# Altium schematic sheet Digital_Supply.SchDoc
size A; SheetNumber: 3; SheetTotal: 6
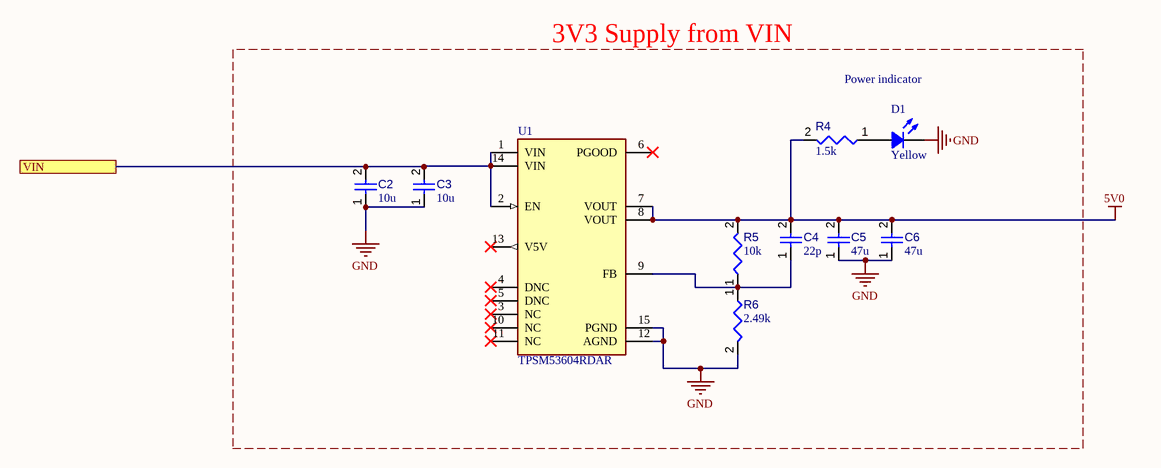
[diagram p0: Digital_Supply.SchDoc]

## Parts
C2  value 10u  [CAPC3216X180X50NL20T25]  (hidden comment: Capacitor 10 uF +/- 10% 16 V 1206)
C3  value 10u  [CAPC3216X180X50NL20T25]  (hidden comment: Capacitor 10 uF +/- 10% 16 V 1206)
C4  value 22p  [CAPC0402(1005)60_L]  (hidden comment: Capacitor 22pF +/-10% 50V 0402)
C5  value 47u  [CAPC3216X180X50NL20T25]  (hidden comment: Capacitor 10 uF +/- 10% 16 V 1206)
C6  value 47u  [CAPC3216X180X50NL20T25]  (hidden comment: Capacitor 10 uF +/- 10% 16 V 1206)
D1  Yellow  [LED 0402_1005 YELLOW]
R4  value 1.5k  [RESC1005X40X25ML05T05]  (hidden comment: Resistor 10k +/-1% 0402 63 mW)
R5  value 10k  [RESC1005X40X25ML05T05]  (hidden comment: Resistor 10k +/-1% 0402 63 mW)
R6  value 2.49k  [RESC1005X40X25ML05T05]  (hidden comment: Resistor 10k +/-1% 0402 63 mW)
U1  TPSM53604RDAR  [FP-RDA0015A-MFG]

## Ports
VIN

## Nets
5V0: C4.2 C5.2 C6.2 R4.2 R5.2 U1.7(VOUT) U1.8(VOUT)
GND: C2.1 C3.1 C5.1 C6.1 D1.2 R6.2 U1.12(AGND) U1.15(PGND)
VIN: C2.2 C3.2 U1.1(VIN) U1.2(EN) U1.14(VIN) ; port VIN
NetC4_1: C4.1 R5.1 R6.1 U1.9(FB)
NetD1_1: D1.1 R4.1

Not connected (* = marked no-connect by the designer): U1 3(NC)* 4(DNC)* 5(DNC)* 6(PGOOD)* 10(NC)* 11(NC)* 13(V5V)*

## Notes on the sheet
- 3V3 Supply from VIN
- Power indicator

## Library data of the parts
C2 C3 C5 C6 = CMP-001-00016-6: Chip Capacitor, 47 uF, +/- 10%, 16 V, 1206 (3216 Metric); Capacitor Type: Ceramic; Voltage Rating: 16V; Tolerance: 10%; Min Operating Temperature: -55°C; Pins: 2; Mounting Technology: SM; Case/Package: 1206; Max Operating Temperature: 125°C; RoHS Compliant: True
C4 = CMP-001-00073-3: Chip Capacitor, 22pF +/-10%, 50V, 0402, Thickness 0.6 mm; Tolerance: 10%; Pins: 2; Voltage Rating: 50V; Max Operating Temperature: 85°C; Min Operating Temperature: -55°C; Mounting Technology: SMT; Case/Package: 0402
D1 = BL-HKC37A-AV-TRB: 0402 YELLOW; Manufacturer: American Bright Optoelectronics Corporation; Configuration: Standard; Current - Test: 20mA; Lens Color: Colorless; Lens Style: Rectangle with Flat Top; Lens Transparency: Clear; Millicandela Rating: 120mcd; Viewing Angle: 120°; Voltage - Forward (Vf) (Typ): 2.2V; Wavelength - Dominant: 589nm; Wavelength - Peak: 590nm; Part Number: BL-HKC37A-AV-TRB; Color: Yellow; ComponentLink1Description: Datasheet; ComponentLink1URL: https://americanbrightled.com/pdffiles/smt/BL-HKC37A-AV-TRB.pdf; ComponentLink2Description: DigiKey Link; ComponentLink2URL: https://www.digikey.com/en/products/detail/american-bright-optoelectronics-corporation/BL-HKC37A-AV-TRB/9678171; Device Package: 0402 (1005 Metric); Height (Max): 0.45mm; LastUpdated: 11/9/2022 10:29:51 am; Lifecycle Status: Active; Minimum Order: 1; Mounting Type: Surface Mount; Package / Case: 0402 (1005 Metric); Packaging: TapeAndReel; PartId: 1041; Part Status: Active; Price: 0.06; Series: -; Size / Dimension: 1.00mm L x 0.50mm W; Supplier 1: DigiKey; Supplier Part Number 1: BL-HKC37A-AV-TRBCT-ND; Supplier Device Package: 0402; Value: Yellow
R4-R6 = CMP-009-00019-5: Chip Resistor, 10 KOhm, +/- 1%, 63 mW, -55 to 155 degC, 0402 (1005 Metric); Power: 63mW; Voltage Rating: 50V; Case/Package: 0402; Mounting Technology: SM; Pins: 2; Min Operating Temperature: -55°C; Tolerance: 1%; RoHS Compliant: True; Max Operating Temperature: 155°C
U1 = CMP-04918-000081-1: DC/DC CONVRTR 36VIN 1V-12VOUT  3; Manufacturer: Texas Instruments; Number Of Outputs: 1; Nominal Supply Current: 24uA; Output Current: 4A; Min Supply Voltage: 3.8V; Switching Topology: Buck-Boost; Output Voltage: 1-7V; Max Supply Voltage: 36V; Output Type: AdjustableProgrammable; Max Duty Cycle: 98%; Switching Frequency: 1.4MHz; Max Junction Temp: +150°C; Temperature Range Low: -40°C; RoHS: TRUE; Device Class L1: Integrated Circuits (ICs); Temperature: -40°C to +125°C; Octopart: https://octopart.com/tpsm53604rdar-texas+instruments-106673079; Ambient Temperature Range High: +105°C; ComponentLink2URL: http://www.ti.com/lit/ds/symlink/tpsm53604.pdf; Digikey Description: DC/DC CONVRTR 36VIN 1V-12VOUT  3; Category: IC; Device Class L2: Power Management ICs; Package: RDA0015A; Manufacturer Part Number: TPSM53604RDAR; ComponentLink2Description: Datasheet; Device Class L3: Voltage Regulators - Switching; Lead Free: Yes; Temperature Range High: +125°C; Ambient Temperature Range Low: -40°C; Automotive: No; Height: 4.1mm